# Altium schematic sheet Power Sematik.SchDoc
size A4; SheetNumber: 2; SheetTotal: 7
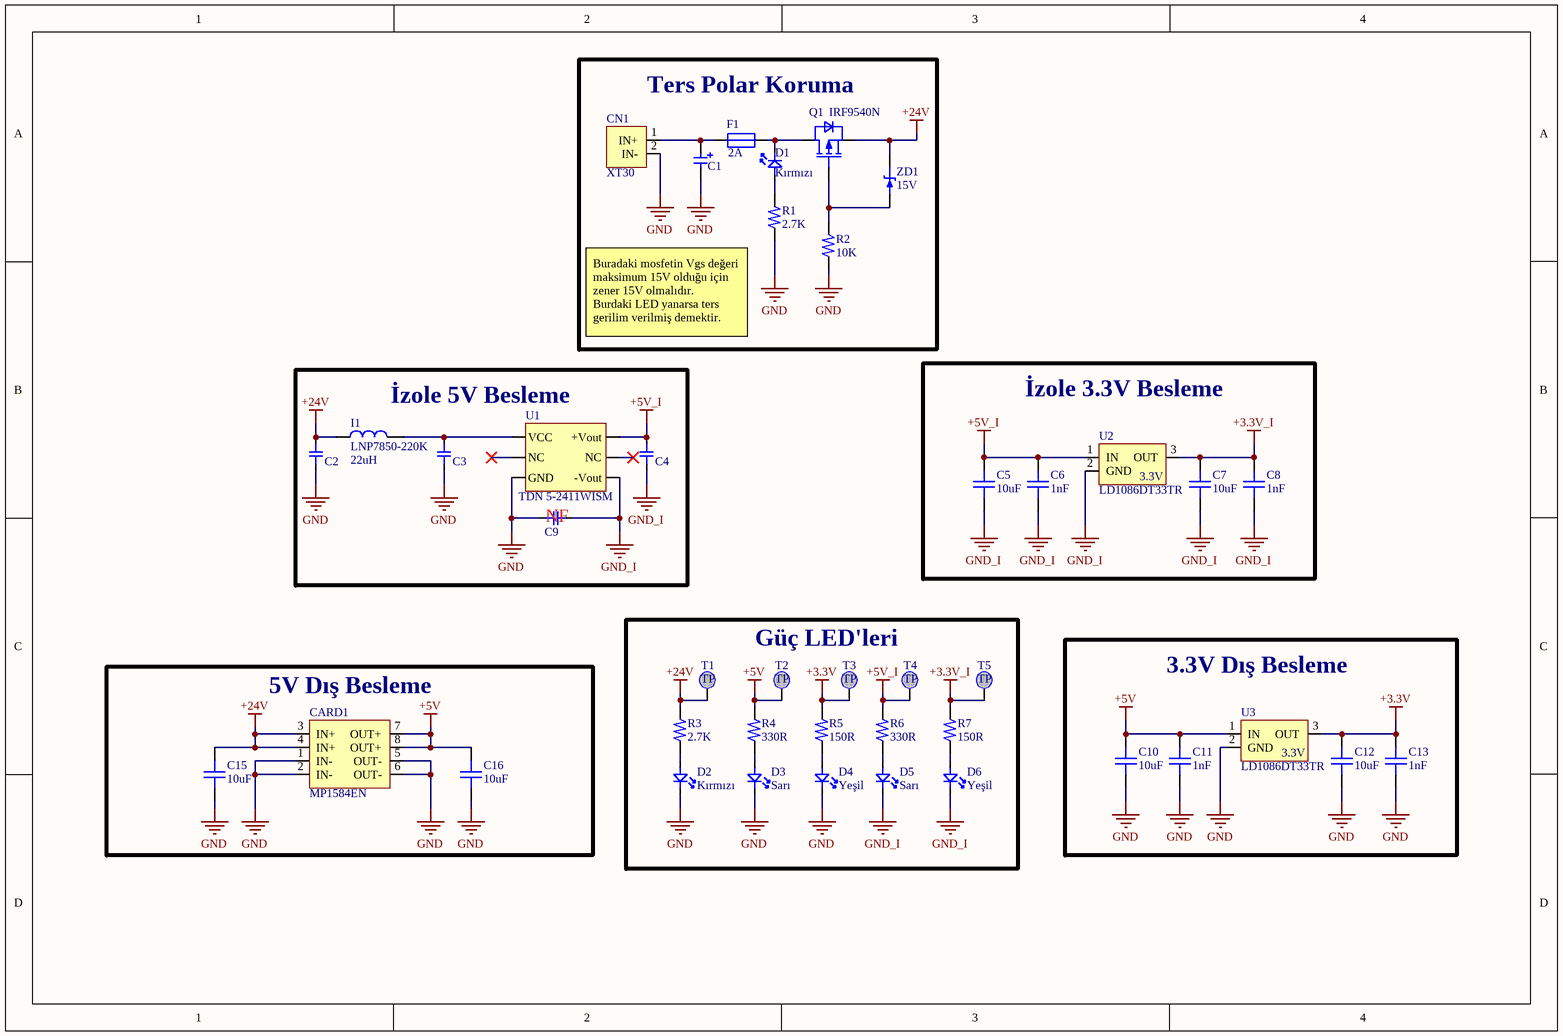
[diagram p0: Power Sematik.SchDoc]

## Parts
C1  CAP_Elec  [CAP_Elec]  (value not drawn)
C2  10uF/50V  [1206_Kapasitör]  (value not drawn)
C3  2.2uF/50V  [1206_Kapasitör]  (value not drawn)
C4  10uF  [1206_Kapasitör]  (value not drawn)
C5  10uF  [0805 Kapasıtor]
C6  1nF  [0805 Kapasıtor]
C7  10uF  [0805 Kapasıtor]
C8  1nF  [0805 Kapasıtor]
C9  330pF/3kV  [1206_Kapasitör]  (value not drawn)
C10  10uF  [0805 Kapasıtor]
C11  1nF  [0805 Kapasıtor]
C12  10uF  [0805 Kapasıtor]
C13  1nF  [0805 Kapasıtor]
C15  10uF  [0805 Kapasıtor]
C16  10uF  [0805 Kapasıtor]
CARD1  MP1584EN  [MP1584]
CN1  XT30  [XT30]
D1  Kırmızı  [0805 LED]
D2  Kırmızı  [0805 LED]
D3  Sarı  [0805 LED]
D4  Yeşil  [0805 LED]
D5  Sarı  [0805 LED]
D6  Yeşil  [0805 LED]
F1  2A  [1808_Sigorta]
I1  LNP7850-220K  value 22uH  [LPN7850]
Q1  IRF9540N  [IFX-PG-TO220-3-904-1]
R1  2.7K  [0805 Dırenc]
R2  10K  [0805 Dırenc]
R3  2.7K  [0805 Dırenc]
R4  330R  [0805 Dırenc]
R5  150R  [0805 Dırenc]
R6  330R  [0805 Dırenc]
R7  150R  [0805 Dırenc]
T1  Test Noktası  [Test Noktası]  (value not drawn)
T2  Test Noktası  [Test Noktası]  (value not drawn)
T3  Test Noktası  [Test Noktası]  (value not drawn)
T4  Test Noktası  [Test Noktası]  (value not drawn)
T5  Test Noktası  [Test Noktası]  (value not drawn)
U1  TDN 5-2411WISM  [Traco 5WISM]
U2  LD1086DT33TR  [DPAK]
U3  LD1086DT33TR  [DPAK]
ZD1  15V  [Zener_Diyot]

## Blocks framed on the sheet
Ters Polar Koruma: C1 CN1 D1 F1 Q1 R1 R2 ZD1
İzole 5V Besleme: C2-C4 C9 I1 U1
İzole 3.3V Besleme: C5-C8 U2
Güç LED'leri: D2-D6 R3-R7 T1-T5
5V Dış Besleme: C15 C16 CARD1
3.3V Dış Besleme: C10-C13 U3

## Nets
+3.3V: C12.2 C13.2 R5.2 T3.1 U3.3(OUT)
+3.3V_I: C7.2 C8.2 R7.2 T5.1 U2.3(OUT)
+5V: C10.2 C11.2 C16.2 CARD1.7(OUT+) CARD1.8(OUT+) R4.2 T2.1 U3.1(IN)
+5V_I: C4.1 C5.2 C6.2 R6.2 T4.1 U1.7(+Vout) U2.1(IN)
+24V: C2.2 C15.2 CARD1.3(IN+) CARD1.4(IN+) I1.1 Q1.3(SOURCE) R3.2 T1.1 ZD1.2(K)
GND: C1.2 C2.1 C3.1 C9.2 C10.1 C11.1 C12.1 C13.1 C15.1 C16.1 CARD1.1(IN-) CARD1.2(IN-) CARD1.5(OUT-) CARD1.6(OUT-) CN1.2(IN-) D2.2 D3.2 D4.2 R1.1 R2.1 U1.2(GND) U3.2(GND)
GND_I: C4.2 C5.1 C6.1 C7.1 C8.1 C9.1 D5.2 D6.2 U1.6(-Vout) U2.2(GND)
NetC1_1: C1.1 CN1.1(IN+) F1.1
NetC3_2: C3.2 I1.2 U1.1(VCC)
NetD1_1: D1.1 R1.2
NetD1_2: D1.2 F1.2 Q1.2(DRAIN)
NetD2_1: D2.1 R3.1
NetD3_1: D3.1 R4.1
NetD4_1: D4.1 R5.1
NetD5_1: D5.1 R6.1
NetD6_1: D6.1 R7.1
NetQ1_1: Q1.1(GATE) R2.2 ZD1.1(A)

Not connected (* = marked no-connect by the designer): U1 4(NC)* 5(NC)*

## Notes on the sheet
- (near R1) Buradaki mosfetin Vgs değeri maksimum 15V olduğu için zener 15V olmalıdır.
  Burdaki LED yanarsa ters gerilim verilmiş demektir.
- (near C9) NF
- (in symbol LD1086DT33TR) 3.3V
- (in symbol Test Noktası) TP

## Library data of the parts
C2-C4 C9 = 1206 CAP
C5-C8 C10-C13 C15 C16 = Kapasitor 0805
CARD1 = MP1584EN_kartı
D1-D6 = 0805 LED
F1 = 1808_Sigorta
Q1 = IRF9540N: OptiMOS - P2 Power-Transistor, P-channel-Enhancement mode, VDS -30V; Manufacturer: Infineon Technologies; Manufacturer Order NumberManufacturer Order Number: IRF9540N; PackageReference: PG-TO220-3-904
R1-R7 = Direnc 0805
ZD1 = BZV55C18
C1 = CAP_Elec: Value: *